# Altium schematic sheet KIT_ARDUINO_COM_R00.SchDoc: KIT ARDUINO 2022
size A4; Author: Valeria Bank; CompanyName: Sistemas De Representacion; Revision: R00; SheetNumber: 4; SheetTotal: 4
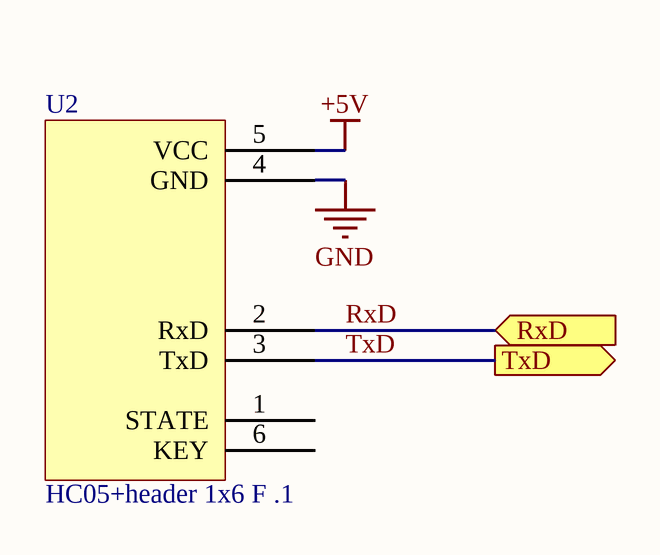
[diagram p0: KIT_ARDUINO_COM_R00.SchDoc]

## Parts
U2  HC05+header 1x6 F .1  [HEADER F 1x6 .1" Horizintal]

## Ports
RxD (in), TxD (out)

## Nets
+5V: U2.5(VCC)
GND: U2.4(GND)
RxD: U2.2(RxD) ; port RxD
TxD: U2.3(TxD) ; port TxD

Not connected (* = marked no-connect by the designer): U2 1(STATE) 6(KEY)

## Notes on the sheet
- Title:
- Size:
- Author:
- A4
- Sheet
- of
- Revision:
- File:
- Date:

## Library data of the parts
U2 = HC05